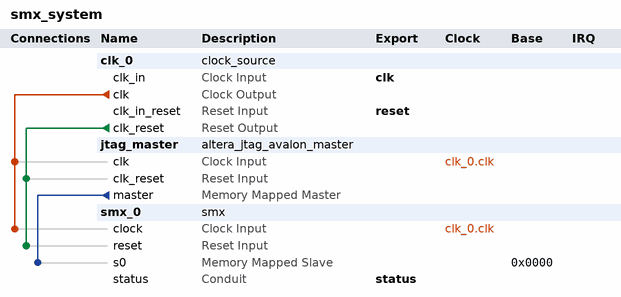
[diagram p0: system contents]
# Platform Designer (Qsys) system smx_system, Cyclone V 5CSXFC6D6F31C6
# Parameters at their usual value, and those the tool derives, are not listed.
package require -exact qsys 18.1
create_system smx_system
set_project_property DEVICE_FAMILY {Cyclone V}
set_project_property DEVICE 5CSXFC6D6F31C6

add_instance clk_0 clock_source 18.1
set_instance_parameter_value clk_0 clockFrequency 50000000
set_instance_parameter_value clk_0 resetSynchronousEdges DEASSERT

add_instance jtag_master altera_jtag_avalon_master 18.1

add_instance smx_0 smx 1.0
set_instance_parameter_value smx_0 N_SEG 8
set_instance_parameter_value smx_0 P 8

# connections
add_connection clk_0.clk jtag_master.clk clock
add_connection clk_0.clk smx_0.clock clock
add_connection clk_0.clk_reset jtag_master.clk_reset reset
add_connection clk_0.clk_reset smx_0.reset reset
add_connection jtag_master.master smx_0.s0 avalon
set_connection_parameter_value jtag_master.master/smx_0.s0 baseAddress 0x0000

# exported interfaces
add_interface clk clock sink
set_interface_property clk EXPORT_OF clk_0.clk_in
add_interface reset reset sink
set_interface_property reset EXPORT_OF clk_0.clk_in_reset
add_interface status conduit end
set_interface_property status EXPORT_OF smx_0.status

set_interconnect_requirement {$system} qsys_mm.clockCrossingAdapter HANDSHAKE
set_interconnect_requirement {$system} qsys_mm.enableEccProtection FALSE
set_interconnect_requirement {$system} qsys_mm.insertDefaultSlave FALSE
set_interconnect_requirement {$system} qsys_mm.maxAdditionalLatency 1

save_system smx_system.qsys
